# EasyEDA Pro project Rear_ESP32S3_R26.epro, board Front_Optical_V0.1
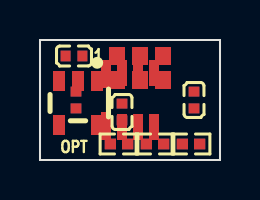
[diagram p8: board, top side]
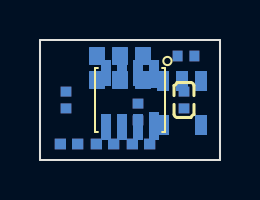
[diagram p9: board, bottom side, seen from below]

Outline 9 x 6 mm; copper layers: Top Layer, Bottom Layer. Coordinates in mm from the lower left corner of the outline.
Outline path: 0,6 9,6 9,0 0,0 0,6
Stack: Top Layer 0.035mm / Dielectric1 1.51mm FR4 er 4.5 / Bottom Layer 0.035mm

## Design rules (mm)
spacing copperThickness1oz (default): track to track 0.102, other pairs 0.152 to 0.3
spacing copperThickness2oz: track to track 0.203, other pairs 0.152 to 0.3
track width copperThickness1oz (default): min 0.127, default 0.254, max 2.54
track width copperThickness2oz: min 0.203, default 0.254, max 2.54
differential pair differentialPair (default): width min 0.127, default 0.254, max 2.54; gap min 0.152, default 0.152

## Placement (name value [footprint] x y rotation side)
C601  4.7uF  [C0402]  1.7 5.2 0 top
C602  10uF  [C0402]  4.1 2.4 90 top
C603  100nF  [C0402]  7.7 3 90 top
C604  4.7uF  [C0402]  1.8 3 90 bottom
NOREF  -  [Pad_e3]  6.15 5.2 0 top
NOREF#2  -  [Pad_e2]  5 5.2 0 top
NOREF#3  -  [Pad_e6]  6.15 4 0 top
NOREF#4  -  [Pad_e1]  3.85 5.2 0 top
NOREF#5  -  [Pad_e5]  5 4 0 top
NOREF#6  -  [Pad_e4]  3.85 4 0 top
R601  4.7kΩ  [R0402]  3.95 0.8 0 top
R602  4.7kΩ  [R0402]  5.75 0.8 0 top
R603  10kΩ  [R0402]  7.55 0.8 0 top
U601  PAT9125EL-TKIT  [LGA-8_L3.5-W3.2-P0.80-BL]  4.5 3 0 bottom
U602  TPS7A2033PDBVR  [SOT-23-5_L2.9-W1.6-P0.95-LS2.8-BR]  1.9 2.85 90 top

## Footprints (pads in the part's own frame, mm; a bottom-side part is the same pattern mirrored in y, then rotated)
C0402
  rect 0.5x0.54 hole 0.001: 1(-0.42,0) 2(0.42,0)
LGA-8_L3.5-W3.2-P0.80-BL
  rect 0.5x1.4 hole 0.001: 1(-1.2,-1.3) 8(-1.2,1.3)
  rect 0.5x1.3 hole 0.001: 2(-0.4,-1.35) 3(0.4,-1.35) 4(1.2,-1.35) 5(1.2,1.35) 6(0.4,1.35) 7(-0.4,1.35)
Pad_e1
  rrect 0.8x0.899 hole 0.001: 1(0,0)
Pad_e2
  rrect 0.8x0.899 hole 0.001: 2(0,0)
Pad_e3
  rrect 0.8x0.899 hole 0.001: 3(0,0)
Pad_e4
  rrect 0.8x0.899 hole 0.001: 4(0,0)
Pad_e5
  rrect 0.8x0.899 hole 0.001: 5(0,0)
Pad_e6
  rrect 0.8x0.899 hole 0.001: 6(0,0)
R0402
  rect 0.566x0.54 hole 0.001: 1(-0.433,0) 2(0.433,0)
SOT-23-5_L2.9-W1.6-P0.95-LS2.8-BR
  rect 1x0.6 hole 0.001: 1(1.1,-0.95) 2(1.1,0) 3(1.1,0.95) 4(-1.1,0.95) 5(-1.1,-0.95)

## Nets
GND: C601.2 C602.2 C603.2 C604.2 NOREF#2.2 NOREF#3.6 U601.4 U601.8 U602.2
VDDA_CAP: C604.1 U601.2
OPT_3V3: C602.1 C603.1 R601.1 R602.1 R603.1 U601.1 U601.3 U602.5
OPT_MOTION_C: NOREF#5.5 R603.2 U601.7
OPT_SCL_C: NOREF.3 R601.2 U601.5
OPT_SDA_C: NOREF#6.4 R602.2 U601.6
VOPT: C601.1 NOREF#4.1 U602.1 U602.3

Pads without a net: U602 4

## Text on the board
Top Silkscreen Layer: OPT | 1
